# EasyEDA Pro project ProPrj_语音模块_2024-10-04.epro

# Schematic 语音模块
Board Name: 语音模块; Create Date: 2024-09-07
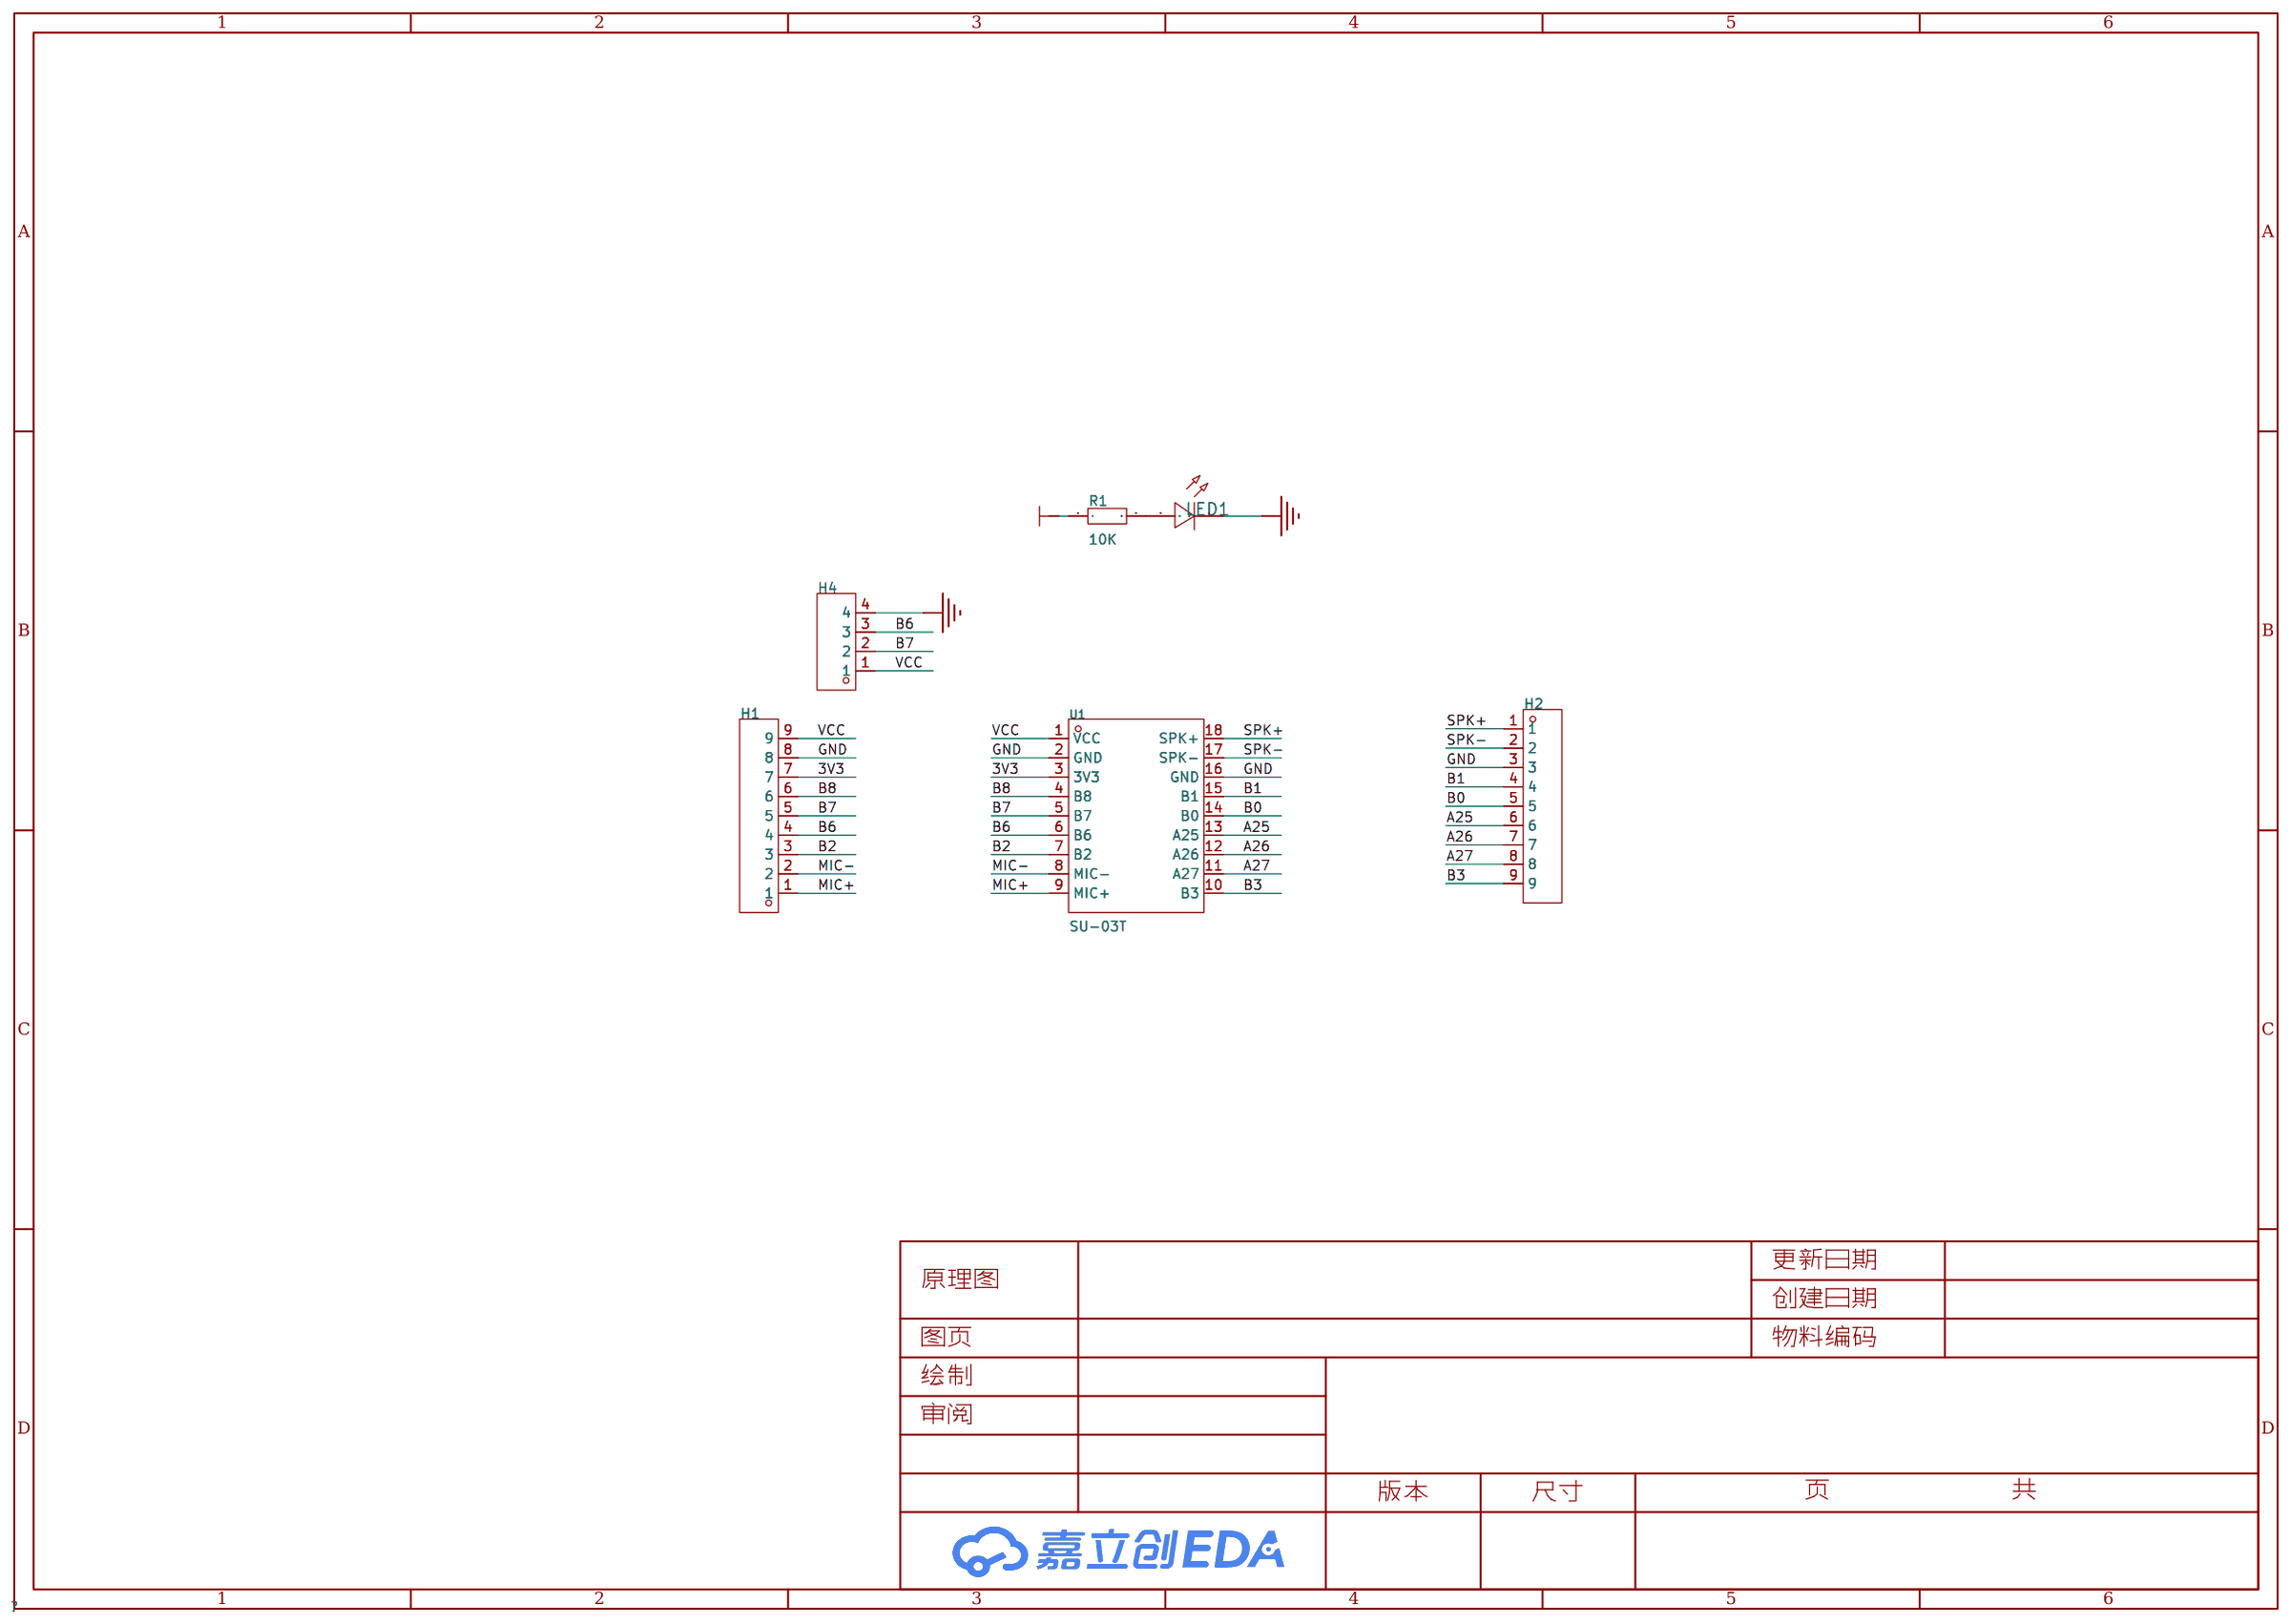
[diagram p0: schematic sheet]

## Parts
H1  -  [HDR-TH_9P-P2.54-V-M]
H2  -  [HDR-TH_9P-P2.54-V-M]
H4  -  [HDR-TH_4P-P2.54-V-F]
LED1  -  [LED_0805]
R1  10K  [R0805]
U1  SU-03T  [COMM-SMD_18P-L21.0-W15.0-P2.00]

## Library data of the parts
H1 H2 = HDR-M_2.54-1x9P: Supplier Part: C492408; Supplier Footprint: 插件
H4 = HDR-F_2.54_1x4P: Supplier Part: C2718488; Supplier Footprint: 插件
LED1 = LED_0805-R: Supplier Footprint: 0805
R1 = Res_0805: Supplier Footprint: 0805
U1 = SU-03T: 处理器:-;运行内存:-;USB:-;WIFI协议:-;蓝牙:-;以太网:-;; Supplier Part: C879203; Manufacturer: MACHINE INTELLIGENCE(机芯智能); JLCPCB Part Class: 扩展库; Datasheet: https://atta.szlcsc.com/upload/public/pdf/source/20201029/C879203_F32AEAE676882DD706CDA0C6D57F9671.pdf; Supplier: LCSC

## Nets
3V3: H1.7 R1.1 U1.3(3V3)
GND: H1.8 H2.3 H4.4 LED1.1(C) U1.2(GND) U1.16(GND)
VCC: H1.9 H4.1 U1.1(VCC)
A25: H2.6 U1.13(A25)
A26: H2.7 U1.12(A26)
A27: H2.8 U1.11(A27)
B0: H2.5 U1.14(B0)
B1: H2.4 U1.15(B1)
B2: H1.3 U1.7(B2)
B3: H2.9 U1.10(B3)
B6: H1.4 H4.3 U1.6(B6)
B7: H1.5 H4.2 U1.5(B7)
B8: H1.6 U1.4(B8)
MIC+: H1.1 U1.9(MIC+)
MIC-: H1.2 U1.8(MIC-)
SPK+: H2.1 U1.18(SPK+)
SPK-: H2.2 U1.17(SPK-)
$1N1391: LED1.2(A) R1.2

# Board 语音模块
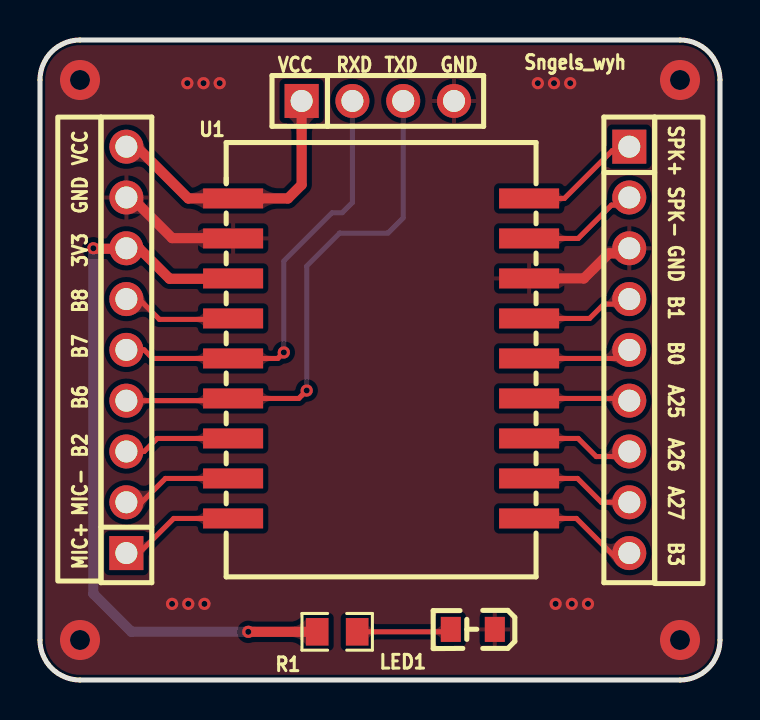
[diagram p1: board, top side]
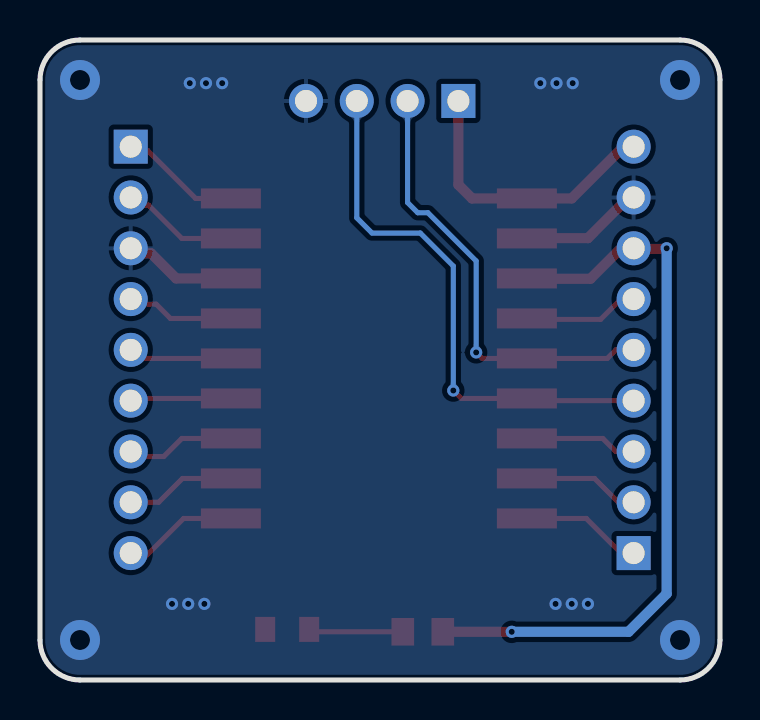
[diagram p2: board, bottom side, seen from below]

Outline 34 x 32 mm; copper layers: Top Layer, Bottom Layer. Coordinates in mm from the lower left corner of the outline.
Outline path: 0,30 0,2 arc(0.59,0.59) 2,0 32,0 arc(33.41,0.59) 34,2 34,30 arc(33.41,31.41) 32,32 2,32 arc(0.59,31.41) 0,30
Stack: Top Layer 0.035mm / Dielectric1 1.51mm FR4 er 4.5 / Bottom Layer 0.035mm

## Design rules (mm)
template: JLCPCB Capability(Two Layers Board)
spacing copperThickness1oz (default): track to track 0.102, other pairs 0.152 to 0.3
spacing copperThickness2oz: track to track 0.203, other pairs 0.152 to 0.3
track width copperThickness1oz (default): min 0.127, default 0.254, max 2.54
track width copperThickness2oz: min 0.203, default 0.254, max 2.54
differential pair differentialPair (default): width min 0.127, default 0.254, max 2.54; gap min 0.152, default 0.152
via viaSize (default): diameter min 0.5, default 0.61, max 10; hole min 0.3, default 0.305, max 6.3

## Placement (name value [footprint] x y rotation side)
H1  -  [HDR-TH_9P-P2.54-V-M]  4.32 16.51 90 top
H2  -  [HDR-TH_9P-P2.54-V-M]  29.46 16.51 270 top
H4  -  [HDR-TH_4P-P2.54-V-F]  16.89 28.95 0 top
LED1  -  [LED_0805]  21.59 2.54 180 top
R1  10K  [R0805]  14.86 2.41 0 top
U1  SU-03T  [COMM-SMD_18P-L21.0-W15.0-P2.00]  17.06 16.08 0 top

## Footprints (pads in the part's own frame, mm; a bottom-side part is the same pattern mirrored in y, then rotated)
COMM-SMD_18P-L21.0-W15.0-P2.00
  rect 3x1 smd: 1(-7.4,8) 2(-7.4,6) 3(-7.4,4) 4(-7.4,2) 5(-7.4,0) 6(-7.4,-2.001) 7(-7.4,-4) 8(-7.4,-6) 9(-7.4,-8) 10(7.4,-8) 11(7.4,-6) 12(7.4,-4) 13(7.4,-2) 14(7.4,0) 15(7.4,2) 16(7.4,4) 17(7.4,6) 18(7.4,8)
HDR-TH_4P-P2.54-V-F
  rect 1.7x1.7 hole 1.1: 1(-3.81,0)
  round 1.7 hole 1.1: 2(-1.27,0) 3(1.27,0) 4(3.81,0)
HDR-TH_9P-P2.54-V-M
  rect 1.7x1.7 hole 1.1: 1(-10.16,0)
  round 1.7 hole 1.1: 2(-7.62,0) 3(-5.08,0) 4(-2.54,0) 5(0,0) 6(2.54,0) 7(5.08,0) 8(7.62,0) 9(10.16,0)
LED_0805
  rect 1x1.25 smd: 1(-1.15,0.005) 2(1.05,0.005)
R0805
  rect 1.133x1.377 smd: 1(-1,0) 2(1,0)

## Nets
As in the schematic.

## Via types
v1: diameter 0.61, hole 0.305, Top Layer to Bottom Layer, 16 vias
v2: diameter 2, hole 1, Top Layer to Bottom Layer, 4 vias

## Routing (per net, layer and track width the routed paths; a pad name or vN(x,y) marks a point on that pad's centre or on a via; arc(x,y) is an arc through that point)
3V3: length 36.9
  Top Layer w0.508: v1(2.67,21.59) 2.69,21.56 4.29,21.56 H1.7 4.95,21.59 6.48,20.06 9.64,20.06 ; v1(10.41,2.41) R1.1
  Bottom Layer w0.508: v1(10.41,2.41) 4.57,2.41 2.67,4.31 v1(2.67,21.59)
GND: length 11.8
  Top Layer w0.508: U1.16 27.19,20.08 28.45,21.33 29.21,21.33 H2.3 ; H1.8 4.57,24.13 6.6,22.09 9.64,22.09 U1.2
  vias: v1(6.6,3.81) v1(7.37,29.84) v1(7.41,3.81) v1(8.18,29.84) v1(8.22,3.81) v1(8.98,29.84) v1(24.89,29.84) v1(25.7,29.84) v1(25.78,3.81) v1(26.51,29.84) v1(26.59,3.81) v1(27.4,3.81) v2(2,30) v2(2,2) v2(32,30) v2(32,2)
VCC: length 14.3
  Top Layer w0.508: H4.1 13.08,24.76 12.4,24.08 U1.1 7.41,24.08 4.85,26.64 4.34,26.64 H1.9
A25: length 5.1
  Top Layer w0.254: H2.6 29.35,14.08 U1.13
A26: length 5.5
  Top Layer w0.254: U1.12 26.91,12.08 27.81,11.17 29.21,11.17 H2.7
A27: length 5.5
  Top Layer w0.254: H2.8 28.07,8.89 26.88,10.08 U1.11
B0: length 5.2
  Top Layer w0.254: U1.14 29.04,16.08 H2.5
B1: length 5.4
  Top Layer w0.254: U1.15 27.48,18.08 28.19,18.79 29.21,18.79 H2.4
B2: length 5.6
  Top Layer w0.254: U1.7 5.86,12.08 5.21,11.43 H1.3
B3: length 5.9
  Top Layer w0.254: H2.9 29.28,6.17 28.73,6.17 26.82,8.08 U1.10
B6: length 27.1
  Top Layer w0.254: v1(13.34,14.47) 12.94,14.08 U1.6 9.54,13.97 H1.4
  Bottom Layer w0.254: v1(13.34,14.47) 13.34,20.7 14.99,22.35 17.4,22.35 18.16,23.11 H4.3
B7: length 22.5
  Top Layer w0.254: v1(12.19,16.38) 11.89,16.08 U1.5 5.63,16.08 5.21,16.51 H1.5
  Bottom Layer w0.254: v1(12.19,16.38) 12.19,20.95 14.6,23.36 15.11,23.36 15.62,23.87 H4.2
B8: length 5.8
  Top Layer w0.254: H1.6 4.95,19.05 5.97,18.03 9.61,18.03 U1.4
MIC+: length 6.1
  Top Layer w0.254: U1.9 6.69,8.08 4.95,6.35 H1.1
MIC-: length 5.8
  Top Layer w0.254: U1.8 6.27,10.08 5.08,8.89 H1.2
SPK+: length 6.1
  Top Layer w0.254: H2.1 29.26,26.46 28.61,26.46 26.22,24.08 U1.18
SPK-: length 5.9
  Top Layer w0.254: U1.17 26.91,22.08 28.57,23.75 29.08,23.75 H2.2
$1N1391: length 5.3
  Top Layer w0.254: R1.2 20.83,2.41 20.71,2.53 LED1.2

## Copper pours and planes (outline as drawn; the poured copper is in the pictures)
GND on Top Layer: -10.54,40.51 52.71,40.51 52.71,-10.29 -10.54,-10.29
GND on Bottom Layer: -9.91,39.62 44.58,39.62 44.58,-9.66 -9.91,-9.66

Small or netless copper shapes (teardrops, artwork), in the pictures only: 44 on Top Layer, 4 on Bottom Layer

## Text on the board
Top Silkscreen Layer: 3V3 | B8 | B7 | B6 | B2 | MIC- | MIC+ | VCC | GND | SPK+ | SPK- | B1 | B0 | A25 | A26 | A27 | B3 | RXD | Sngels_wyh | TXD
